# Altium schematic sheet Communication.SchDoc
size A4; DocumentNumber: 4; SheetNumber: 5; SheetTotal: 8
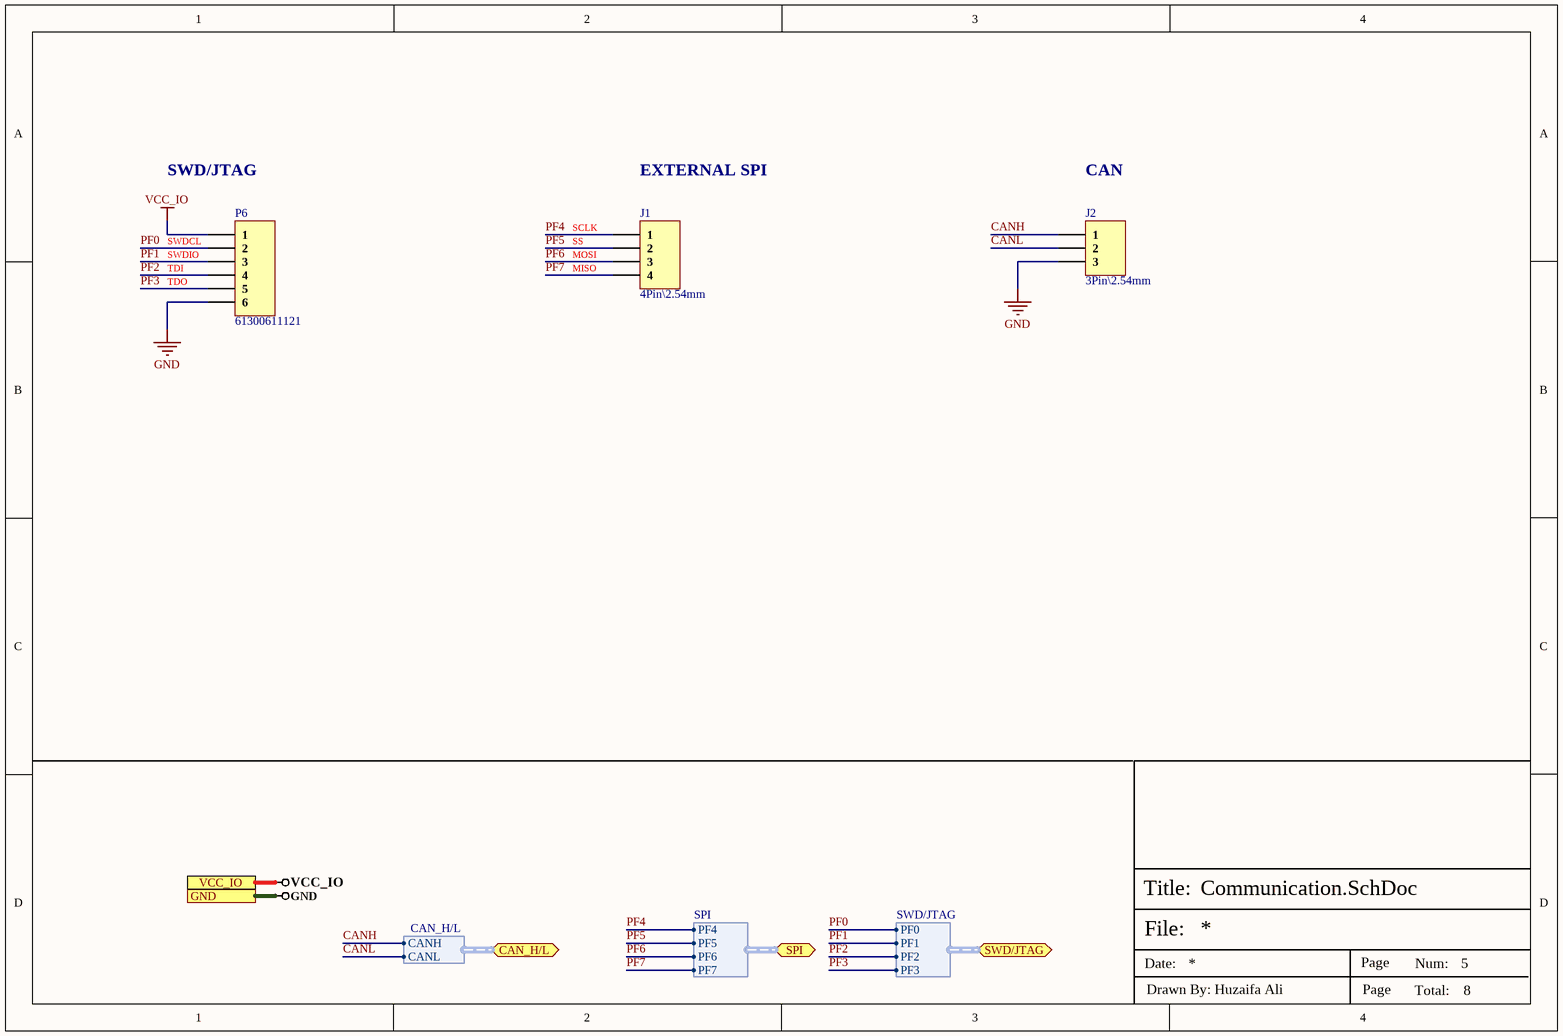
[diagram p0: Communication.SchDoc]

## Parts
J1  4Pin\2.54mm  [HDR1X4_]
J2  3Pin\2.54mm  [HDR1X3_]
P6  61300611121  [HDR1X6_]

## Ports
CAN_H/L (bidir, harness CAN_H/L), GND, SPI (bidir, harness SPI), SWD/JTAG (bidir, harness SWD/JTAG), VCC_IO

## Harnesses
SWD/JTAG: PF0, PF1, PF2, PF3
SPI: PF4, PF5, PF6, PF7
CAN_H/L: CANH, CANL

## Nets
GND: J2.3 P6.6 ; port GND
VCC_IO: P6.1 ; port VCC_IO
CANH: J2.1 ; port CAN_H/L.CANH
CANL: J2.2 ; port CAN_H/L.CANL
PF0: P6.2 ; port SWD/JTAG.PF0
PF1: P6.3 ; port SWD/JTAG.PF1
PF2: P6.4 ; port SWD/JTAG.PF2
PF3: P6.5 ; port SWD/JTAG.PF3
PF4: J1.1 ; port SPI.PF4
PF5: J1.2 ; port SPI.PF5
PF6: J1.3 ; port SPI.PF6
PF7: J1.4 ; port SPI.PF7

## Notes on the sheet
- SWD/JTAG
- EXTERNAL SPI
- CAN
- (near P6) SWDCL
- SS
- (near J1) SCLK
- (near P6) SWDIO
- (near P6) TDO
- (near P6) TDI
- (near J1) MISO
- (near J1) MOSI
- File:
- Title:
- Date:
- Page
- Num:
- Total:
- Drawn By: Huzaifa Ali

## Library data of the parts
J1 = B-2100S04P-A110: Straight 2.54mm 6mm -40℃~+105℃ 3mm 4 2.54mm 单排 Black Brass 1x4P Plugin,P=2.54mm Pin Headers ROHS; Manufacturer: Ckmtw; Item Type: Header; LCSC Part Number: C124378; Manufacturer Part Number: B-2100S04P-A110
J2 = B-2100S03P-A110: Straight 2.54mm Black Brass 1x3P Plugin,P=2.54mm Pin Headers ROHS; Manufacturer: Ckmtw; Item Type: Header; LCSC Part Number: C124376; Manufacturer Part Number: B-2100S03P-A110
P6 = 61300611121: CONN HEADER 6 POS 2.54; Manufacturer: Wurth Electronics; Current Rating: 3A; Voltage Rating: 250V; Number of Positions: 6; Gender: Male; Connector Type: Male Pin; Pitch: 0.1inch; Supplier 1: Newark; Manufacturer Part Number: 61300611121; RoHS: Yes; Category: Headers and Wire Housings; Stock 1: 4996; Pricing 1: 1=0.34000, 10=0.28900, 25=0.24000, 50=0.20100, 100=0.18200 (USD); Mount: Through Hole; Contact Plating: Gold; Contact Material: Copper Alloy,Copper; Housing Material: PBT; Color: Black; Min Operating Temperature: -40°C; Max Operating Temperature: 125°C; Number of Rows: 1; Contact Gender: Male; Packaging: Bulk; Termination: Through Hole; Number of Contacts: 6; Series: WR-PHD; Contact Type: Male Pin; Contact Mating Length: 0.236inch; REACH SVHC: Unknown; Lead Free: Lead Free; RoHS Compliant: Yes; ComponentLink1URL: http://www.mouser.com/ds/2/445/6130xx11121-538006.pdf?src-supplier=Mouser; ComponentLink1Description: http://www.mouser.com/ds/2/445/6130xx11121-538006.pdf?src-supplier=Mouser; ComponentLink2URL: http://www.farnell.com/cad/1737268.pdf?src-supplier=Element14; ComponentLink2Description: http://www.farnell.com/cad/1737268.pdf?src-supplier=Element14; ComponentLink3URL: https://katalog.we-online.de/em/datasheet/6130xx11121.pdf?src-supplier=Digi-Key; ComponentLink3Description: https://katalog.we-online.de/em/datasheet/6130xx11121.pdf?src-supplier=Digi-Key; Supplier Part Number 1: 20X0957